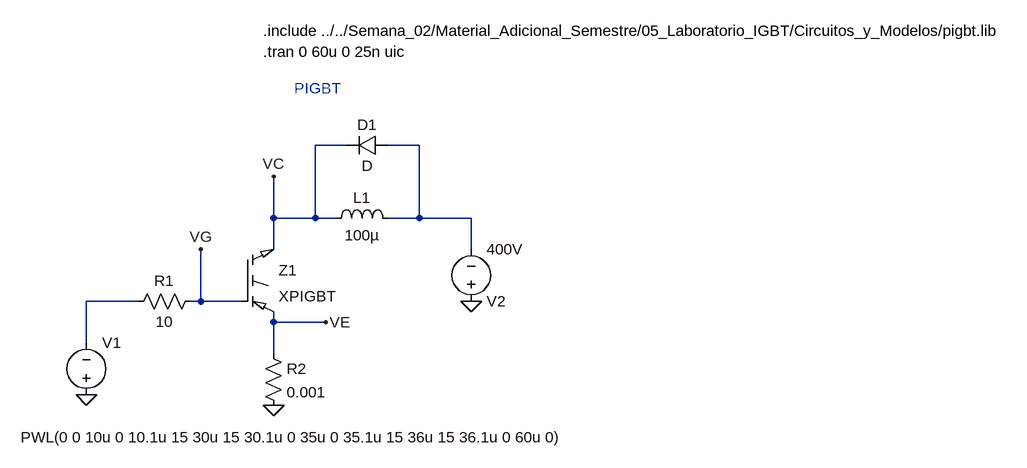
[diagram p0: schematic DPT_PIGBT.asc]
DPT_PIGBT.asc, the LTspice schematic file:
Version 4.1
SHEET 1 904 680
WIRE 368 -64 320 -64
WIRE 480 -64 432 -64
WIRE 256 48 256 -16
WIRE 320 48 320 -64
WIRE 320 48 256 48
WIRE 352 48 320 48
WIRE 480 48 480 -64
WIRE 480 48 432 48
WIRE 560 48 480 48
WIRE 256 96 256 48
WIRE 560 96 560 48
WIRE 48 176 -32 176
WIRE 144 176 144 96
WIRE 144 176 128 176
WIRE 208 176 144 176
WIRE 256 208 256 192
WIRE 336 208 256 208
WIRE -32 240 -32 176
WIRE 256 256 256 208
FLAG -32 320 0
FLAG 256 336 0
FLAG 560 176 0
FLAG 144 96 VG
FLAG 256 -16 VC
FLAG 336 208 VE
SYMBOL Misc\\PIGBT 208 96 R0
SYMATTR InstName Z1
SYMATTR Value XPIGBT
SYMATTR Prefix X
SYMBOL diode 432 -80 R90
WINDOW 0 0 32 VBottom 2
WINDOW 3 32 32 VTop 2
SYMATTR InstName D1
SYMBOL ind 336 64 R270
WINDOW 0 32 56 VTop 2
WINDOW 3 5 56 VBottom 2
SYMATTR InstName L1
SYMATTR Value 100µ
SYMATTR SpiceLine Rser=1m
SYMBOL res 144 160 R90
WINDOW 0 0 56 VBottom 2
WINDOW 3 32 56 VTop 2
SYMATTR InstName R1
SYMATTR Value 10
SYMBOL res 240 240 R0
SYMATTR InstName R2
SYMATTR Value 0.001
SYMBOL voltage -32 336 M180
WINDOW 3 -101 -49 Left 2
WINDOW 0 24 96 Left 2
SYMATTR Value PWL(0 0 10u 0 10.1u 15 30u 15 30.1u 0 35u 0 35.1u 15 36u 15 36.1u 0 60u 0)
SYMATTR InstName V1
SYMBOL voltage 560 192 M180
WINDOW 123 0 0 Left 0
WINDOW 39 0 0 Left 0
SYMATTR InstName V2
SYMATTR Value 400V
TEXT 240 -240 Left 2 !.include ../../Semana_02/Material_Adicional_Semestre/05_Laboratorio_IGBT/Circuitos_y_Modelos/pigbt.lib
TEXT 240 -208 Left 2 !.tran 0 60u 0 25n uic
TEXT 288 -152 Left 2 ;PIGBT

The netlist it stands for:
* DPT_PIGBT.asc
X§Z1 VC VG VE XPIGBT  ; pins C G E
D1 N001 VC D
L1 VC N001 100µ Rser=1m
R1 VG N002 10
R2 VE 0 0.001
V1 0 N002 PWL(0 0 10u 0 10.1u 15 30u 15 30.1u 0 35u 0 35.1u 15 36u 15 36.1u 0 60u 0)
V2 0 N001 400V
.model D D
.lib standard.dio
.include ../../Semana_02/Material_Adicional_Semestre/05_Laboratorio_IGBT/Circuitos_y_Modelos/pigbt.lib
.tran 0 60u 0 25n uic
* PIGBT
.backanno
.end